# Altium schematic sheet ESP_SHEET.SchDoc
size A; SheetNumber: 2; SheetTotal: 9
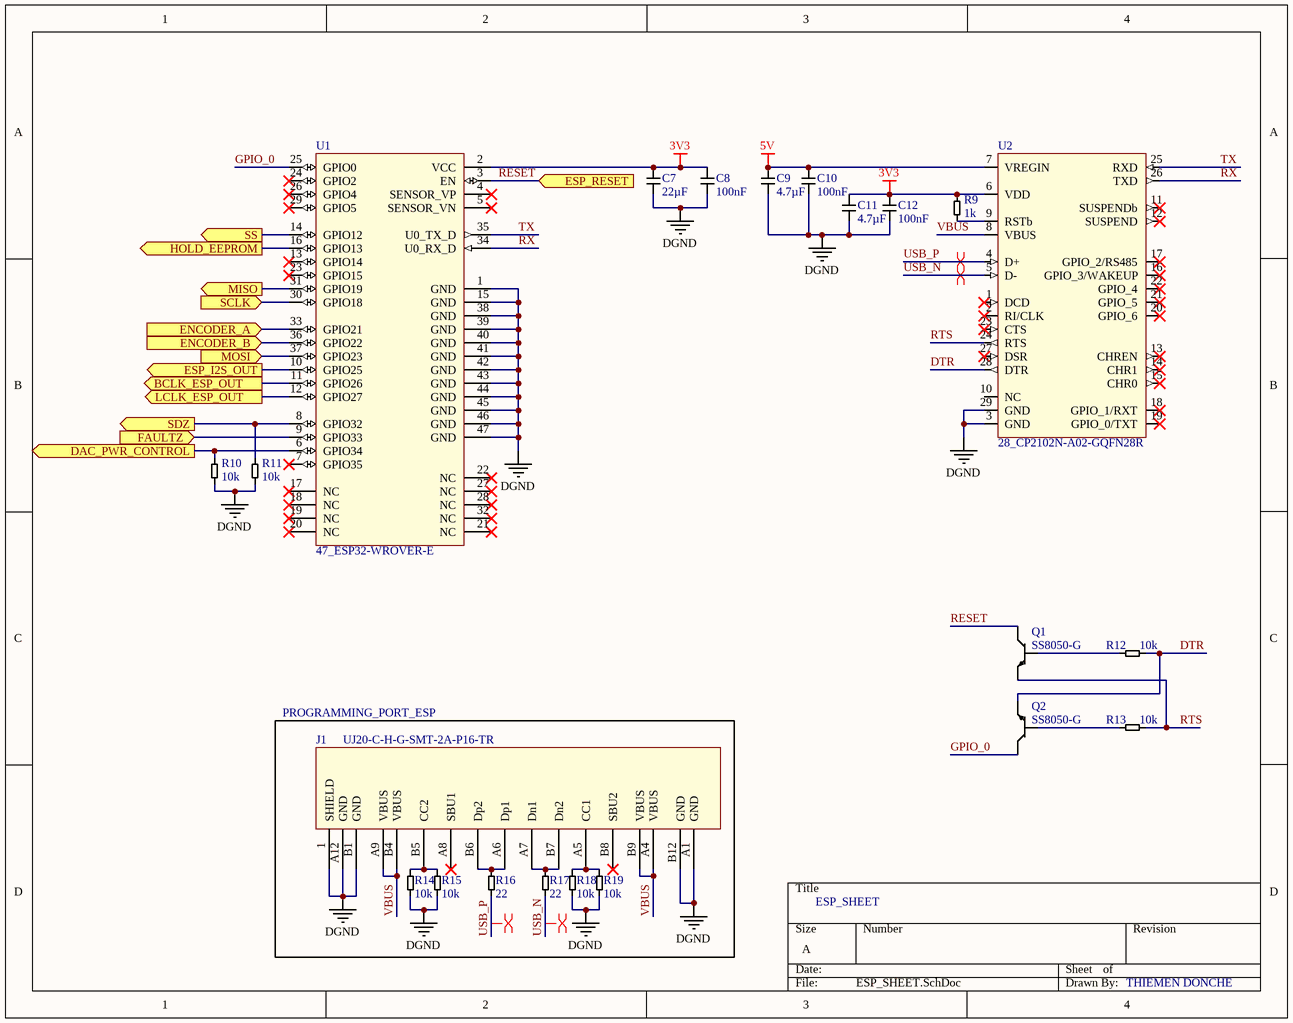
[diagram p0: ESP_SHEET.SchDoc]

## Parts
C7  22µF  [0603_SMD_CAP]
C8  100nF  [0603_SMD_CAP]
C9  4.7µF  [0603_SMD_CAP]
C10  100nF  [0603_SMD_CAP]
C11  4.7µF  [0603_SMD_CAP]
C12  100nF  [0603_SMD_CAP]
J1  type: UJ20-C-H-G-SMT-2A-P16-TR  [12 pin USB connector]  (hidden comment: 12pin_USB-CONNECTOR)
Q1  type: SS8050-G  [SOT23 FOOTPRINT]  (hidden comment: NPN TRANSISTOR)
Q2  type: SS8050-G  [SOT23 FOOTPRINT]  (hidden comment: NPN TRANSISTOR)
R9  1k  [0603_SMD_PACKAGE]
R10  10k  [0603_SMD_PACKAGE]
R11  10k  [0603_SMD_PACKAGE]
R12  10k  [0603_SMD_PACKAGE]
R13  10k  [0603_SMD_PACKAGE]
R14  10k  [0603_SMD_PACKAGE]
R15  10k  [0603_SMD_PACKAGE]
R16  22  [0603_SMD_PACKAGE]
R17  22  [0603_SMD_PACKAGE]
R18  10k  [0603_SMD_PACKAGE]
R19  10k  [0603_SMD_PACKAGE]
U1  47_ESP32-WROVER-E  [LGA-47_ ESP32-WROVER-E-N16R8]
U2  28_CP2102N-A02-GQFN28R  [QFN-28_CP2102N-A02-GQFN28R]

## Blocks framed on the sheet
PROGRAMMING_PORT_ESP: J1 R14-R19

## Ports
BCLK_ESP_OUT (out, see TOP_SHEET[2A]), DAC_PWR_CONTROL (out, see TOP_SHEET[1A], DAC_SHEET[1B]), ENCODER_A (in, see TOP_SHEET[1A], PERIPHERAL_SHEET[1D]), ENCODER_B (in, see TOP_SHEET[1A], PERIPHERAL_SHEET[1D]), ESP_I2S_OUT (out, see TOP_SHEET[2A]), ESP_RESET (in, see TOP_SHEET[1A], PERIPHERAL_SHEET[1B]), FAULTZ (in, see TOP_SHEET[1B], AMPLIFIER_SHEET[1B]), HOLD_EEPROM (out, see TOP_SHEET[2B]), LCLK_ESP_OUT (out, see TOP_SHEET[2A]), MISO (out, see TOP_SHEET[2B], ADAU_PERIPHERALS[2C]), MOSI (in, see TOP_SHEET[2B], ADAU_PERIPHERALS[4C]), SCLK (in, see TOP_SHEET[2B], ADAU_PERIPHERALS[4C]), SDZ (out, see TOP_SHEET[1B], AMPLIFIER_SHEET[1C]), SS (out, see TOP_SHEET[2B], ADAU_PERIPHERALS[3C])

## Nets
3V3: C7.2 C8.2 C11.2 C12.2 R9.2 U1.2(VCC) U2.6(VDD)
5V: C9.2 C10.2 U2.7(VREGIN)
DGND: C7.1 C8.1 C9.1 C10.1 C11.1 C12.1 J1.1(SHIELD) J1.A1(GND) J1.A12(GND) J1.B1(GND) J1.B12(GND) R10.1 R11.1 R14.1 R15.1 R18.1 R19.1 U1.1(GND) U1.15(GND) U1.38(GND) U1.39(GND) U1.40(GND) U1.41(GND) U1.42(GND) U1.43(GND) U1.44(GND) U1.45(GND) U1.46(GND) U1.47(GND) U2.3(GND) U2.29(GND)
BCLK_ESP_OUT: U1.11(GPIO26) ; port BCLK_ESP_OUT
DAC_PWR_CONTROL: R10.2 U1.6(GPIO34) ; port DAC_PWR_CONTROL
DTR: Q2.2(E) R12.2 U2.28(DTR)
ENCODER_A: U1.33(GPIO21) ; port ENCODER_A
ENCODER_B: U1.36(GPIO22) ; port ENCODER_B
ESP_I2S_OUT: U1.10(GPIO25) ; port ESP_I2S_OUT
FAULTZ: U1.9(GPIO33) ; port FAULTZ
GPIO_0: Q2.3(C) U1.25(GPIO0)
HOLD_EEPROM: U1.16(GPIO13) ; port HOLD_EEPROM
LCLK_ESP_OUT: U1.12(GPIO27) ; port LCLK_ESP_OUT
MISO: U1.31(GPIO19) ; port MISO
MOSI: U1.37(GPIO23) ; port MOSI
RESET: Q1.3(C) U1.3(EN) ; port ESP_RESET
RTS: Q1.2(E) R13.2 U2.24(RTS)
RX: U1.34(U0_RX_D) U2.26(TXD)
SCLK: U1.30(GPIO18) ; port SCLK
SDZ: R11.2 U1.8(GPIO32) ; port SDZ
SS: U1.14(GPIO12) ; port SS
TX: U1.35(U0_TX_D) U2.25(RXD)
USB_N: R17.1 U2.5(D-)
USB_P: R16.1 U2.4(D+)
VBUS: J1.A4(VBUS) J1.A9(VBUS) J1.B4(VBUS) J1.B9(VBUS) U2.8(VBUS)
NetJ1_A5: J1.A5(CC1) R18.2 R19.2
NetJ1_A6: J1.A6(Dp1) J1.B6(Dp2) R16.2
NetJ1_A7: J1.A7(Dn1) J1.B7(Dn2) R17.2
NetJ1_B5: J1.B5(CC2) R14.2 R15.2
NetQ1_1: Q1.1(B) R12.1
NetQ2_1: Q2.1(B) R13.1
NetR9_1: R9.1 U2.9(RSTb)

Not connected (* = marked no-connect by the designer): J1 A8(SBU1)* B8(SBU2)*; U1 4(SENSOR_VP)* 5(SENSOR_VN)* 7(GPIO35)* 13(GPIO14)* 17(NC)* 18(NC)* 19(NC)* 20(NC)* 21(NC)* 22(NC)* 23(GPIO15)* 24(GPIO2)* 26(GPIO4)* 27(NC)* 28(NC)* 29(GPIO5)* 32(NC)*; U2 1(DCD)* 2(RI/CLK)* 10(NC) 11(SUSPENDb)* 12(SUSPEND)* 13(CHREN)* 14(CHR1)* 15(CHR0)* 16(GPIO_3/WAKEUP)* 17(GPIO_2/RS485)* 18(GPIO_1/RXT)* 19(GPIO_0/TXT)* 20(GPIO_6)* 21(GPIO_5)* 22(GPIO_4)* 23(CTS)* 27(DSR)*

## Layout directives
differential pair: USB_N, USB_P

## Notes on the sheet
- ESP_SHEET
- THIEMEN DONCHE

## Library data of the parts
C7-C12 = ceramic capacator: type: *
J1 = 12pin_USB-CONNECTOR: pin to pad: A1>A1/B12 A4>A4/B9 A9>B4/A9 A12>B1/A12 B1>B1/A12 B4>B4/A9 B9>A4/B9 B12>A1/B12
R9-R19 = resistor: type: *
U1 = 47_ESP32-WROVER-E: 200MHz clock , output P = 20 dBm, Ub =3V-3.6V, BLE + bluetooth 4.2; Supplier 1: Mouser; Supplier Part Number 1: 356-ESP32WRVIE2864UC
U2 = 28_CP2102N-A02-GQFN28R: USB->UART, Vb: 3V-3.6V, USB2.0,3MBs; Supplier 1: Farnell; Supplier Part Number 1: CP2102N-A02-GQFN28R